# EAGLE design Adafruit LT8912B DSI to DVI Converter Rev B (EAGLE 9.6.2)
COMPANY: ADAFRUIT INDUSTRIES; DRAWN: KTOWN; REV: A
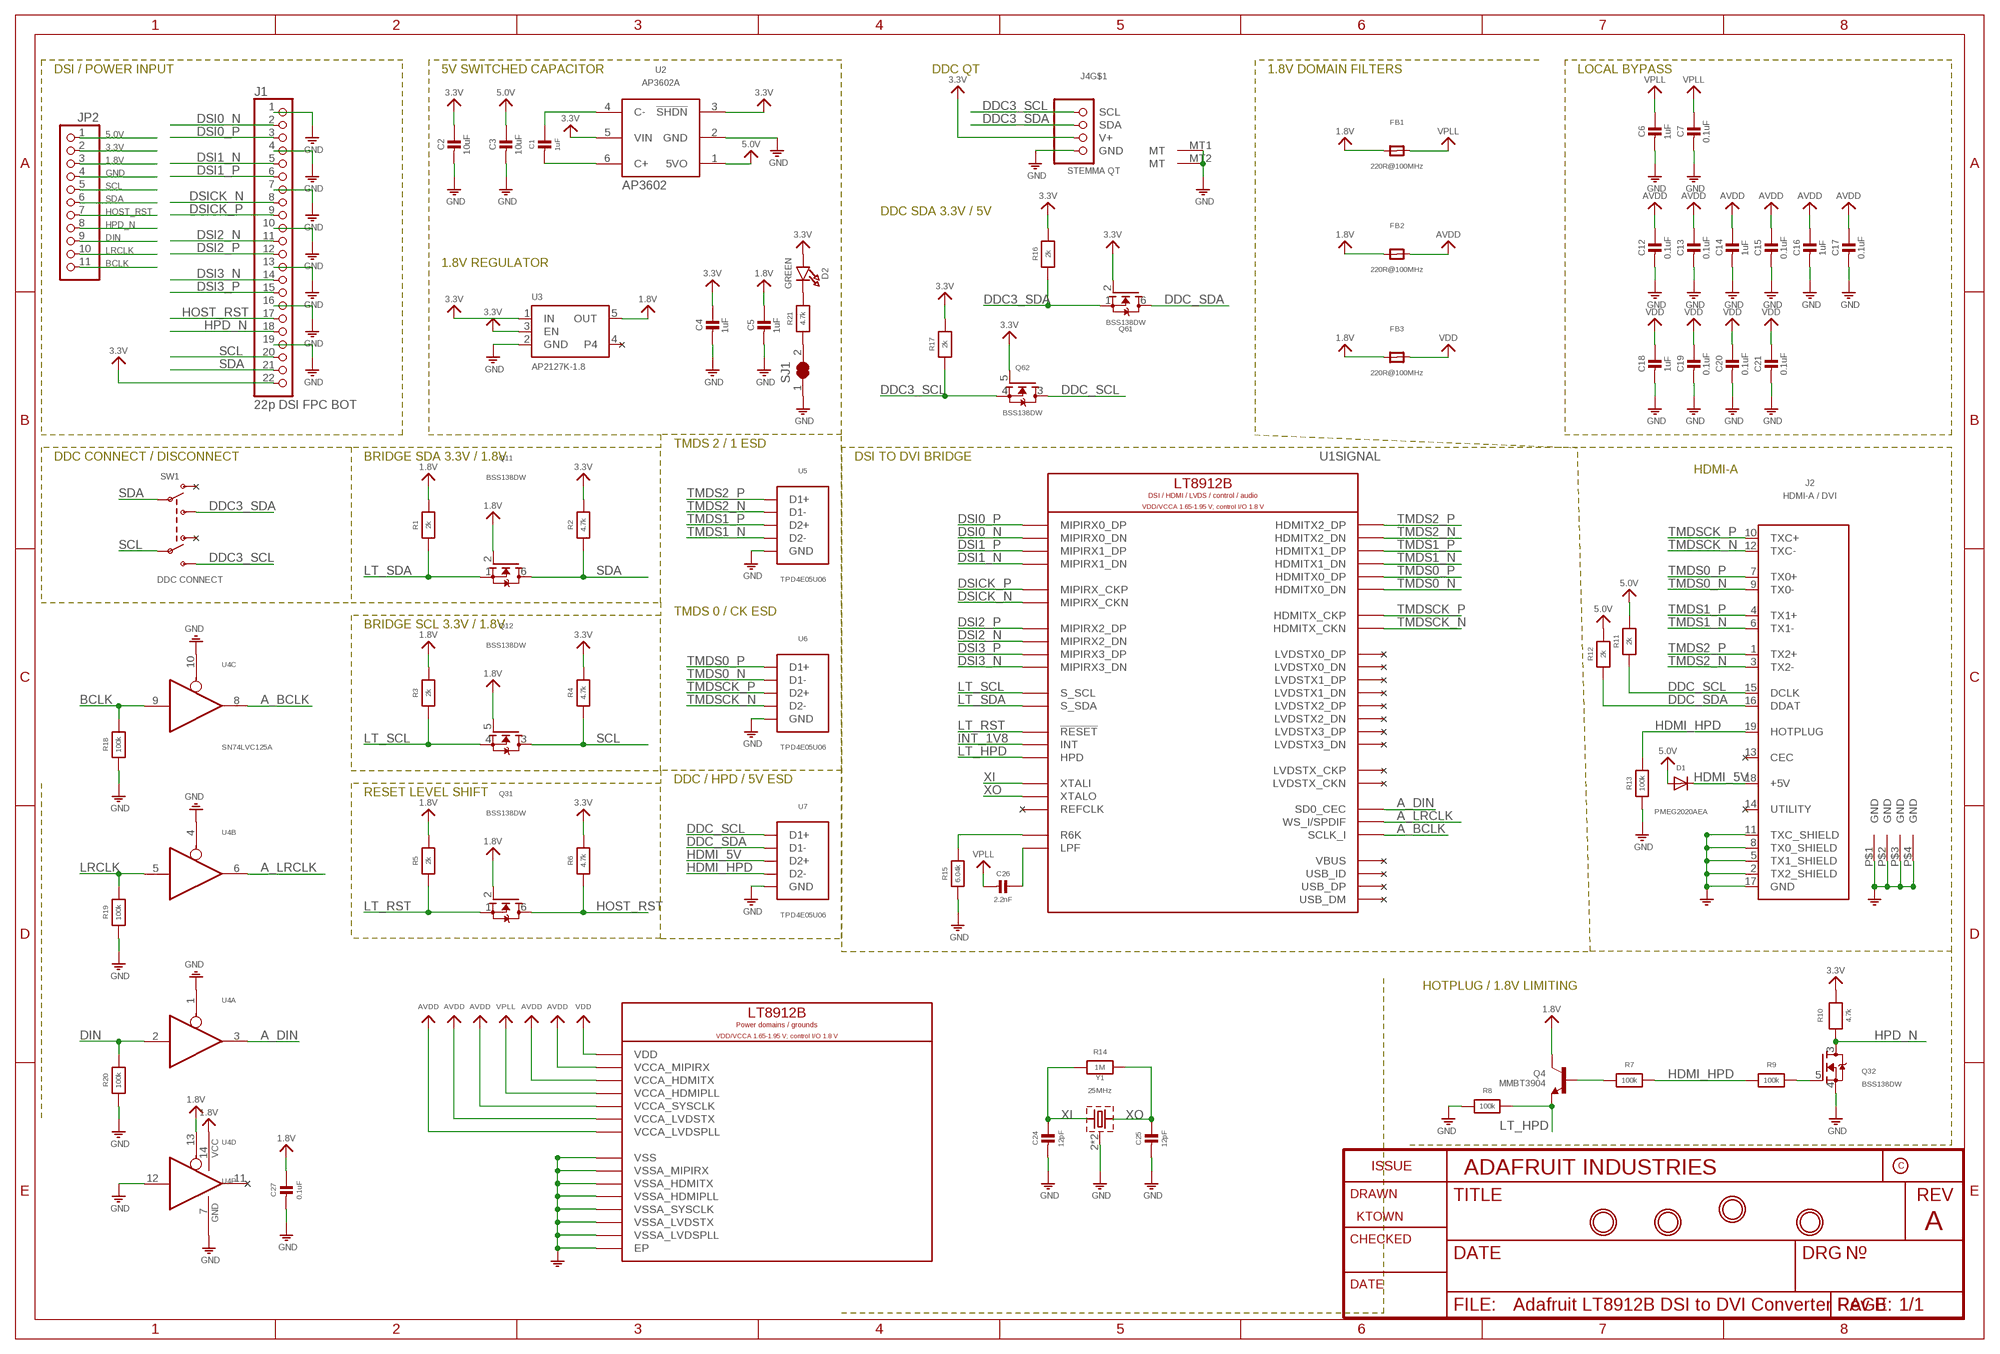
[diagram p0: schematic, sheet 1]

## Parts
C1  1uF  CAP_CERAMIC0603_NO  [0603-NO]
C2  10uF  CAP_CERAMIC0805-NOOUTLINE  [0805-NO]
C3  10uF  CAP_CERAMIC0805-NOOUTLINE  [0805-NO]
C4  1uF  CAP_CERAMIC0603_NO  [0603-NO]
C5  1uF  CAP_CERAMIC0603_NO  [0603-NO]
C6  1uF  CAP_CERAMIC0603_NO  [0603-NO]
C7  0.1uF  CAP_CERAMIC0603_NO  [0603-NO]
C12  0.1uF  CAP_CERAMIC0603_NO  [0603-NO]
C13  0.1uF  CAP_CERAMIC0603_NO  [0603-NO]
C14  1uF  CAP_CERAMIC0603_NO  [0603-NO]
C15  0.1uF  CAP_CERAMIC0603_NO  [0603-NO]
C16  1uF  CAP_CERAMIC0603_NO  [0603-NO]
C17  0.1uF  CAP_CERAMIC0603_NO  [0603-NO]
C18  1uF  CAP_CERAMIC0603_NO  [0603-NO]
C19  0.1uF  CAP_CERAMIC0603_NO  [0603-NO]
C20  0.1uF  CAP_CERAMIC0603_NO  [0603-NO]
C21  0.1uF  CAP_CERAMIC0603_NO  [0603-NO]
C24  12pF  CAP_CERAMIC0603_NO  [0603-NO]
C25  12pF  CAP_CERAMIC0603_NO  [0603-NO]
C26  2.2nF  CAP_CERAMIC0603_NO  [0603-NO]
C27  0.1uF  CAP_CERAMIC0603_NO  [0603-NO]
D1  PMEG2020AEA  DIODESOD-323F  [SOD-323F]
D2  GREEN  LED0603_NOOUTLINE  [CHIPLED_0603_NOOUTLINE]
FB1  220R@100MHz  FERRITE-0603NO  [0603-NO]
FB2  220R@100MHz  FERRITE-0603NO  [0603-NO]
FB3  220R@100MHz  FERRITE-0603NO  [0603-NO]
J1  22p DSI FPC BOT  HEADER-1X22_22PIN_0.5MM_BOT  [FPC_22PIN]
J2  HDMI-A / DVI  HDMI_MOLEX_47151  [HDMI_MOLEX_47151-0001]
J4  STEMMA QT  STEMMA_I2C_QT  [JST_SH4]
JP2  HEADER-1X11  [1X11_ROUND]
Q1  BSS138DW  MOSFET-N_DUAL  [SOT363]
Q3  BSS138DW  MOSFET-N_DUAL  [SOT363]
Q4  MMBT3904  TRANSISTOR_NPN  [SOT23-R]
Q6  BSS138DW  MOSFET-N_DUAL  [SOT363]
R1  2k  RESISTOR_0603_NOOUT  [0603-NO]
R2  4.7k  RESISTOR_0603_NOOUT  [0603-NO]
R3  2k  RESISTOR_0603_NOOUT  [0603-NO]
R4  4.7k  RESISTOR_0603_NOOUT  [0603-NO]
R5  2k  RESISTOR_0603_NOOUT  [0603-NO]
R6  4.7k  RESISTOR_0603_NOOUT  [0603-NO]
R7  100k  RESISTOR_0603_NOOUT  [0603-NO]
R8  100k  RESISTOR_0603_NOOUT  [0603-NO]
R9  100k  RESISTOR_0603_NOOUT  [0603-NO]
R10  4.7k  RESISTOR_0603_NOOUT  [0603-NO]
R11  2k  RESISTOR_0603_NOOUT  [0603-NO]
R12  2k  RESISTOR_0603_NOOUT  [0603-NO]
R13  100k  RESISTOR_0603_NOOUT  [0603-NO]
R14  1M  RESISTOR_0603_NOOUT  [0603-NO]
R15  6.04k  RESISTOR_0603_NOOUT  [0603-NO]
R16  2k  RESISTOR_0603_NOOUT  [0603-NO]
R17  2k  RESISTOR_0603_NOOUT  [0603-NO]
R18  100k  RESISTOR_0603_NOOUT  [0603-NO]
R19  100k  RESISTOR_0603_NOOUT  [0603-NO]
R20  100k  RESISTOR_0603_NOOUT  [0603-NO]
R21  4.7k  RESISTOR_0603_NOOUT  [0603-NO]
SJ1  SOLDERJUMPER_CLOSED  [SOLDERJUMPER_CLOSEDWIRE]
SW1  DDC CONNECT  SWITCH_DPDTEG1390  [EG1390]
U1  LT8912B  [QFN64_7.5X7.5_P04_EP62_LT8912B]
U2  AP3602A  AP3602  [SOT23-6]
U3  AP2127K-1.8  VREG_SOT23-5  [SOT23-5]
U4  SN74LVC125A  74125PW  [TSSOP14]
U5  TPD4E05U06  [USON10_1X2.5_P05_TPD4E05U06]
U6  TPD4E05U06  [USON10_1X2.5_P05_TPD4E05U06]
U7  TPD4E05U06  [USON10_1X2.5_P05_TPD4E05U06]
U$1  MOUNTINGHOLE2.5  [MOUNTINGHOLE_2.5_PLATED]
U$2  MOUNTINGHOLE2.5  [MOUNTINGHOLE_2.5_PLATED]
U$3  MOUNTINGHOLE2.5  [MOUNTINGHOLE_2.5_PLATED]
U$4  MOUNTINGHOLE2.5  [MOUNTINGHOLE_2.5_PLATED]
Y1  25MHz  CRYSTAL_GND2.0X1.6  [CRYSTAL_2X1.6]

## Nets
1.8V: C5.1 C27.1 FB1.1 FB2.1 FB3.1 JP2.3 Q1.2(1:G) Q1.5(2:G) Q3.2(1:G) Q4.3(C) R1.2 R3.2 R5.2 U3.5(OUT) U4.13(D:OE) U4.14(P:VCC)
3.3V: C2.1 C4.1 D2.A J1.22 J4.2(V+) JP2.2 Q6.2(1:G) Q6.5(2:G) R2.2 R4.2 R6.2 R10.2 R16.2 R17.2 U2.3(!SHDN) U2.5(VIN) U3.1(IN) U3.3(EN)
5.0V: C3.1 D1.A JP2.1 R11.2 R12.2 U2.1(5VO)
A_BCLK: U1.60(SIGNAL:SCLK_I) U4.8(C:O)
A_DIN: U1.58(SIGNAL:SD0_CEC) U4.3(A:O)
A_LRCLK: U1.59(SIGNAL:WS_I/SPDIF) U4.6(B:O)
AVDD: C12.1 C13.1 C14.1 C15.1 C16.1 C17.1 FB2.2 U1.5(POWER:VCCA_MIPIRX) U1.26(POWER:VCCA_HDMITX) U1.41(POWER:VCCA_LVDSTX) U1.50(POWER:VCCA_SYSCLK) U1.52(POWER:VCCA_LVDSPLL)
BCLK: JP2.11 R18.2 U4.9(C:I)
BIAS: R15.2 U1.13(SIGNAL:R6K)
DDC3_SCL: J4.4(SCL) Q6.4(2:S) R17.1 SW1.S2
DDC3_SDA: J4.3(SDA) Q6.1(1:S) R16.1 SW1.S1
DDC_SCL: J2.15(DCLK) Q6.3(2:D) R11.1 U7.1(D1+) U7.10(D1+)
DDC_SDA: J2.16(DDAT) Q6.6(1:D) R12.1 U7.2(D1-) U7.9(D1-)
DIN: JP2.9 R20.2 U4.2(A:I)
DSI0_N: J1.2 U1.2(SIGNAL:MIPIRX0_DN)
DSI0_P: J1.3 U1.1(SIGNAL:MIPIRX0_DP)
DSI1_N: J1.5 U1.4(SIGNAL:MIPIRX1_DN)
DSI1_P: J1.6 U1.3(SIGNAL:MIPIRX1_DP)
DSI2_N: J1.11 U1.10(SIGNAL:MIPIRX2_DN)
DSI2_P: J1.12 U1.9(SIGNAL:MIPIRX2_DP)
DSI3_N: J1.14 U1.12(SIGNAL:MIPIRX3_DN)
DSI3_P: J1.15 U1.11(SIGNAL:MIPIRX3_DP)
DSICK_N: J1.8 U1.8(SIGNAL:MIPIRX_CKN)
DSICK_P: J1.9 U1.7(SIGNAL:MIPIRX_CKP)
FLY_+: C1.2 U2.6(C+)
FLY_-: C1.1 U2.4(C-)
GND: C2.2 C3.2 C4.2 C5.2 C6.2 C7.2 C12.2 C13.2 C14.2 C15.2 C16.2 C17.2 C18.2 C19.2 C20.2 C21.2 C24.2 C25.2 C27.2 J1.1 J1.4 J1.7 J1.10 J1.13 J1.16 J1.19 J2.2(TX2_SHIELD) J2.5(TX1_SHIELD) J2.8(TX0_SHIELD) J2.11(TXC_SHIELD) J2.17(GND) J2.P$1(GND) J2.P$2(GND) J2.P$3(GND) J2.P$4(GND) J4.1(GND) J4.MT1(MT) J4.MT2(MT) JP2.4 Q3.4(2:S) R8.1 R13.1 R15.1 R18.1 R19.1 R20.1 SJ1.1 U1.6(POWER:VSSA_MIPIRX) U1.17(POWER:VSS) U1.23(POWER:VSSA_HDMITX) U1.29(POWER:VSSA_HDMITX) U1.32(POWER:VSS) U1.36(POWER:VSSA_HDMIPLL) U1.42(POWER:VSSA_LVDSTX) U1.49(POWER:VSSA_SYSCLK) U1.51(POWER:VSSA_LVDSPLL) U1.56(POWER:VSS) U1.EP(POWER:EP) U2.2(GND) U3.2(GND) U4.1(A:OE) U4.4(B:OE) U4.7(P:GND) U4.10(C:OE) U4.12(D:I) U5.3(GND) U5.8(GND) U6.3(GND) U6.8(GND) U7.3(GND) U7.8(GND) Y1.2(GND) Y1.4(GND)
HDMI_5V: D1.C J2.18(+5V) U7.4(D2+) U7.7(D2+)
HDMI_HPD: J2.19(HOTPLUG) R7.1 R9.1 R13.2 U7.5(D2-) U7.6(D2-)
HOST_RST: J1.17 JP2.7 Q3.6(1:D) R6.1
HPD_BASE: Q4.1(B) R7.2
HPD_HOST_B: Q3.5(2:G) R9.2
HPD_N: J1.18 JP2.8 Q3.3(2:D) R10.1
INT_1V8: U1.63(SIGNAL:INT)
LPF: C26.1 U1.35(SIGNAL:LPF)
LRCLK: JP2.10 R19.2 U4.5(B:I)
LT_HPD: Q4.2(E) R8.2 U1.14(SIGNAL:HPD)
LT_RST: Q3.1(1:S) R5.1 U1.64(SIGNAL:!RESET)
LT_SCL: Q1.4(2:S) R3.1 U1.62(SIGNAL:S_SCL)
LT_SDA: Q1.1(1:S) R1.1 U1.61(SIGNAL:S_SDA)
N$1: R21.1 SJ1.2
N$2: D2.C R21.2
SCL: J1.20 JP2.5 Q1.3(2:D) R4.1 SW1.P2
SDA: J1.21 JP2.6 Q1.6(1:D) R2.1 SW1.P1
TMDS0_N: J2.9(TX0-) U1.24(SIGNAL:HDMITX0_DN) U6.2(D1-) U6.9(D1-)
TMDS0_P: J2.7(TX0+) U1.25(SIGNAL:HDMITX0_DP) U6.1(D1+) U6.10(D1+)
TMDS1_N: J2.6(TX1-) U1.27(SIGNAL:HDMITX1_DN) U5.5(D2-) U5.6(D2-)
TMDS1_P: J2.4(TX1+) U1.28(SIGNAL:HDMITX1_DP) U5.4(D2+) U5.7(D2+)
TMDS2_N: J2.3(TX2-) U1.30(SIGNAL:HDMITX2_DN) U5.2(D1-) U5.9(D1-)
TMDS2_P: J2.1(TX2+) U1.31(SIGNAL:HDMITX2_DP) U5.1(D1+) U5.10(D1+)
TMDSCK_N: J2.12(TXC-) U1.21(SIGNAL:HDMITX_CKN) U6.5(D2-) U6.6(D2-)
TMDSCK_P: J2.10(TXC+) U1.22(SIGNAL:HDMITX_CKP) U6.4(D2+) U6.7(D2+)
VDD: C18.1 C19.1 C20.1 C21.1 FB3.2 U1.18(POWER:VDD) U1.33(POWER:VDD) U1.57(POWER:VDD)
VPLL: C6.1 C7.1 C26.2 FB1.2 U1.34(POWER:VCCA_HDMIPLL)
XI: C24.1 R14.1 U1.53(SIGNAL:XTALI) Y1.1
XO: C25.1 R14.2 U1.54(SIGNAL:XTALO) Y1.3
Unconnected: J2.13(CEC) J2.14(UTILITY) SW1.O1 SW1.O2 U1.15(SIGNAL:VBUS) U1.16(SIGNAL:USB_ID) U1.19(SIGNAL:USB_DP) U1.20(SIGNAL:USB_DM) U1.37(SIGNAL:LVDSTX3_DP) U1.38(SIGNAL:LVDSTX3_DN) U1.39(SIGNAL:LVDSTX_CKP) U1.40(SIGNAL:LVDSTX_CKN) U1.43(SIGNAL:LVDSTX2_DP) U1.44(SIGNAL:LVDSTX2_DN) U1.45(SIGNAL:LVDSTX1_DP) U1.46(SIGNAL:LVDSTX1_DN) U1.47(SIGNAL:LVDSTX0_DP) U1.48(SIGNAL:LVDSTX0_DN) U1.55(SIGNAL:REFCLK) U3.4 U4.11(D:O)

## Notes on the sheet
- DSI / POWER INPUT | 5V SWITCHED CAPACITOR | DDC QT | 1.8V DOMAIN FILTERS | LOCAL BYPASS
- DDC SDA 3.3V / 5V
- 1.8V REGULATOR
- TMDS 2 / 1 ESD
- DDC CONNECT / DISCONNECT | BRIDGE SDA 3.3V / 1.8V | DSI TO DVI BRIDGE
- HDMI-A
- TMDS 0 / CK ESD
- BRIDGE SCL 3.3V / 1.8V
- DDC / HPD / 5V ESD
- RESET LEVEL SHIFT
- HOTPLUG / 1.8V LIMITING

## Library data of the parts
C1-C7 C12-C21 C24-C27 = microbuilder:CAP_CERAMIC: Ceramic Capacitors For new designs, use the packages preceded by an '_' character since they are more reliable: The following footprints should be used on most boards: _0402 - Standard footprint for regular board layouts _0603 - Standard footprint for regular board layouts _0805 - Standard footprint for regular board layouts _1206 - Standard footprint for regular board layouts For extremely tight-pitch boards where space is at a premium, the following 'micro-pitch' footprints can be used (smaller pads, no silkscreen outline, etc.): _0402MP - Micro-pitch footprint for very dense/compact boards _0603MP - Micro-pitch footprint for very dense/compact boards _0805MP - Micro-pitch footprint for very dense/compact boards _1206MP - Micro-pitch footprint for very dense/compact boards
D1 = adafruit:DIODE: Diode SMADIODE - SMA Surface Mount Package 20V 1A Schottky Diode Digikey: 641-1014-6-ND DO-1N4148 - Through Hole Small Current Diode SOD-123 20V 1 A (.5mV Vf) Schottky Diode - Digikey: MBRX120TPMSCT-ND SOD-323 10V 570mA (.38mV Vf, 3ns) Schottky Diode - Digikey: ZLLS410CT-ND SOD-523 30V 30mA Schottky Diode (RB751S-40TE61) - Digikey: RB751S-40TE61CT-ND SOT23-R/W - SOT23 Package (R = Solder Paste/Reflow Ovens, W = Hand-Soldering) BAT54Film 40V 300mA - Digikey: 497-7162-1-ND; LCSC: C389354; MPN: PMEG2020AEA
D2 = microbuilder:LED: LED 0603 - 0603 Surface Mount Package 2mA: Green LED - Low Power (3.9mcd, 2ma, 1.7Vf) - Digikey: 475-2709-2-ND Orange LED - Low Power (9.8mcd, 2ma, 1.8Vf) - Digikey: 475-1194-2-ND Red LED - Low Power (5mcd, 2ma, 1.8Vf) - Digikey: 475-1195-2-ND Yellow LED - Low Power (7mcd, 2ma, 1.8Vf) - Digikey: 475-1196-2-ND 5mA: Blue LED - Low Power (17mcd, 5ma, 2.9Vf) - Digikey: LNJ937W8CRACT-ND 0805 - 0805 Surface Mount Package 2mA: Red LED (8.8mcd, 2mA, 1.8Vf, Clear) - Low Power [Digikey: 475-2510-1-ND] Green LED (5mcd, 2mA, 1.8Vf, Clear) - Low Power [Digikey: 475-2730-1-ND] Yellow LED (11.3mcd, 2mA, 1.8Vf, Clear) - Low Power [Digikey: 475-2555-1-ND] 20mA: Red LED (104mcd, 20mA, Diffused) - LS R976 [Digikey: 475-1278-6-ND] Red LED (12mcd, 20mA, 2.0Vf, Clear) - APT2012EC [Digikey: 754-1128-1-ND] Green LED (15mcd, 20mA, 2.2Vf, Clear) - APT2012GC [Digikey: 754-1131-1-ND] Orange LED (160mcd, 20mA, 2.1Vf, Clear) - APT2012SECK [Digikey: 754-1130-1-ND] 1206 - 1206 Surface Mount Package Green LED (26mcd, 20mA, Diffused) - LG N971 [Digikey: 475-1407-6-ND] Red LED (15mcd, 20mA, Diffused) - LH N974 [Digikey: 475-1416-6-ND] Cree - Cree High-Power Surface Mount LEDs XPEBWT-L1-0000-00D50 - White 111lm 350mA 2.9Vf 6200K 110° XTEAWT-00-0000-00000LEE3 - White 114lm 350mA 2.85Vf 5000K 115° Everlight - Everlight 45-21 Series Surface Mount LEDs 45-21/QK2C-B2832AC2CB2/2T - Warm White 2000mcd 20mA 3.25Vf 3050K 120° 45-21/LK2C-B38452C4CB2/2T - Nuetral White 2000mcd 20mA 3.25Vf 4150K 120° 45-21/LK2C-B50634C6CB2/2T - Cold White 2200mcd 20mA 3.25Vf 5650K 120° PLCC2 Reverse Mount LS T77K-J1L2-1-0-2-R18-Z - Red 11.25mcd 2mA 1.8Vf 630nm 120° LO T77K-L1M2-24-Z - Orange 19.6mcd 2mA 1.8Vf 606nm 120° LY T77K-K2M1-26-Z - Yellow 15.7mcd 2mA 1.8Vf 587nm 120°; ROT: 270
FB1-FB3 = microbuilder:FERRITE: Ferrite Bead 0603 MMZ1608B121C - 120 Ohm @ 100MHz, 600mA, 0.15 Ohm DC Resistance - Digikey: 445-2164-1-ND BK1608HW121-T - 120 Ohm, 600mA Ferrite Chip - Digikey: 587-1876-2-ND 0805 HZ0805B272R-10 - 2.7K Ohm @ 100MHz, 200mA, 0.8 Ohm DC Resistance - Digikey: 240-2504-1-ND (see also Murata BLM21BD272SN1L) MMZ2012Y152B - 1.5K Ohm @ 100MHz, 500mA, 0.4 Ohm DC Resistance - Digikey: 445-1560-1-ND - Mainly for high frequency (80-400MHz) MMZ2012R102A - 1K Ohm @ 100MHz, 500mA, 0.3 Ohm DC Resistance - Digikey: 445-1555-2-ND - More general purpose (10-200MHz); SELECTION_STATUS: MPN/current/DCR to qualify
J1 = adafruit_electromech:HEADER-1X22; LCSC: C262668; MPN: AFC01-S22FCA-00
J2 = adafruit_electromech:HDMI_MOLEX_47151: The default footprint uses layer 46 (Milling) for the tabs, the DIMLAYER footprint uses layer 20 (Dimensions). Both will probably require special instructions to the board house; LCSC: C138388; MPN: HDMI-001 19PCBTP
J4 = adafruit_electromech:STEMMA_I2C; LCSC: C2905006
JP2 = microbuilder:HEADER-1X11
Q1 Q3 Q6 = microbuilder:MOSFET-N_DUAL: Dual N-Channel MOSFET SOT363 (2.0x1.25mm) 2N7002PS - 60V, 320mA [Digikey: 568-5984-1-ND]; JLC_ROTATION: 270; LCSC: C154900; MPN: BSS138DW-7-F
Q4 = microbuilder:TRANSISTOR_NPN: NPN Transistor Transistor (NPN) 500mA 45V - BC817 [Digikey: 568-1631-1-ND] Transistor (NPN) 500mA 45V - BC817,215 [Mouser: 771-BC817-T/R] SOT23-R - SOT23 footprint optimised for use with solder paste and reflow ovens. SOT23-W - SOT23 footprint optimised for hand-soldering (larger pads).
R1-R21 = microbuilder:RESISTOR: Resistors For new designs, use the packages preceded by an '_' character since they are more reliable: The following footprints should be used on most boards: _0402 - Standard footprint for regular board layouts _0603 - Standard footprint for regular board layouts _0805 - Standard footprint for regular board layouts _1206 - Standard footprint for regular board layouts For extremely tight-pitch boards where space is at a premium, the following 'micro-pitch' footprints can be used (smaller pads, no silkscreen outline, etc.): _0402MP - Micro-pitch footprint for very dense/compact boards _0603MP - Micro-pitch footprint for very dense/compact boards _0805MP - Micro-pitch footprint for very dense/compact boards _1206MP - Micro-pitch footprint for very dense/compact boards
SJ1 = microbuilder:SOLDERJUMPER_CLOSED: Solder Jumper - Closed These solder jumpers are closed by default CLOSEDWIRE - 10 mil trace between pads that can be cut and resoldered later CLOSEDPERM - 63 mil trace between pads for a permanent connection (used to 'bridge' two signals, a shameless hack for Eagle). Can double as a test point as well (no cream layer)
SW1 = adafruit_electromech:SWITCH_DPDT: Switch - DPDT A DPDT Switch acts like an SPDT switch, but has a pair of switches instead of just one. Vertical - 0.3A @ 6V SMT - Digikey: JS202011SCQN; LCSC: C2837066; MPN: MS-22C01-G010
U1 = adafruit_display:LT8912B: Lontium LT8912B / LCSC C2892102, single-channel MIPI DSI to HDMI/LVDS. QFN64 7.5 mm, single 1.8 V supply; CMOS pins are NOT 3.3 V tolerant. SIGNAL and POWER gates retain all 64 functional pads plus EP. Unused DSI lanes, LVDS/audio/USB functions remain real pins, not NC. RESET_N is drawn as !RESET; INT is multifunction I/O, without an inferred overbar. No DDC/HDCP. Host must provide monitor DDC separately. Pin map: LT8912B R1.13 table 6.2.1, matching LT8912 R1.7 pin-function table and Espressif ESP-HDMI-Bridge 2024-08-28. Do not use the inconsistent overview pin diagram in the old combined datasheet.; LCSC: C2892102; MANUFACTURER: Lontium Semiconductor; MPN: LT8912B
U2 = microbuilder:AP3602; LCSC: C460358; MPN: AP3602AKTR-G1
U3 = adafruit_power:VREG_SOT23-5: SOT23-5 Fixed Voltage Regulators Part Current Out V Out V In V Dropout θJA (°C/W) TJ (°C) Digikey Part No. ADP121 150mA 3.3V 3.4-5.5V 0.09V @ 150mA -- -- ADP121-AUJZ33R7CT-ND ADP121 150mA 3.0V 3.1-5.5V 0.09V @ 150mA -- -- ADP121-AUJZ30R7CT-ND ADP122 300mA 3.3V 3.4-5.5V 0.085V @ 300mA -- -- ADP122AUJZ-3.3-R7CT-ND ADP1712 300mA 3.3V 3.5-5.5V 0.17V @ 300mA -- -- ADP1712AUJZ-3.3-R7TR-ND AP7311 (Low Cost) 150mA 3.3V 3.5-6V 0.15V @ 150mA -- -- AP7311-33WG-7DICT-ND LD39015M18R 150mA 1.8V 1.9V-5.5V 0.08V @ 100mA -- -- 497-6977-1-ND LP2985A-33DBVR 150mA 3.3V 3.3-16V 0.28V @ 150mA 206 150 296-18479-1-ND MCP1824T-3302E/OT 300mA 3.3V 3.5V-6V 0.2V @ 300mA -- -- MCP1824T-3302E/OTCT-ND MIC5205-2.5YM5 TR 150mA 2.5V 2.7-16V 0.165V @ 150mA -- -- 576-1257-2-ND MIC5205-3.0YM5 TR 150mA 3.0V 3.2V-16V 0.165V @ 150mA -- -- 576-1258-2-ND MIC5205-3.3YM5 TR 150mA 3.3V 3.5V-16V 0.165V @ 150mA -- -- 576-1259-2-ND TPS780330220 150mA 3.3V+2.2V 3.6-5.5V 250mV Max -- -- 296-23332-1-ND TDA3663/N1,135 100mA 3.3V 3.5-45V 0.18V @ 50mA -- -- 568-5343-1-ND Max operating temp can be calculated using θJA, TJ (max junction temperature), and power in watts. Set the "Maximum Ambient Temperature" until it reaches TJ ("Max Junction Temperature"), which is the absolute limit for safe use of the regulator: Heat Sink Temperature Calculator <http://www.daycounter.com/Calculators/Heat-Sink-Temperature-Calculator.phtml> For example, With 12V source into a 3.3V LP2985 and a 30mA load, we are dissipating (12V-3.3V) * 0.03A = 0.261W. With a θJA of 206 °C/W, a TJ of 150°C, and 261mW we can safely use the chip without a heat sink up to 75°C (=147.1°C Junction Temperature).; JLC_ROTATION: 270; LCSC: C151375; MPN: AP2127K-1.8TRG1
U4 = adafruit:74*125: Quad bus BUFFER, 3-state; LCSC: C7813; MPN: SN74LVC125APWR
U5-U7 = adafruit_power:TPD4E05U06: Genuine Texas Instruments TPD4E05U06DQAR, C138714. Four 5.5 V ESD channels, 0.5 pF typical; HDMI application in SLVSBO7O p.13. GND maps to pads 3 and 8 with route=all. Pads 6,7,9,10 are internally NC but used for PCB pass-through routing per TI SLVSBO7O pp.4/17. Signal pairs 1-10, 2-9, 4-7, 5-6 use route=all and must be joined by PCB traces; they are not internally connected. Place beside the connector with short signal and ground paths.; LCSC: C138714; MANUFACTURER: Texas Instruments; MPN: TPD4E05U06DQAR
U$1-U$4 = adafruit_electromech:MOUNTINGHOLE: Mounting Hole For #2 screws (0.086"/2.18mm width, 0.094"/2.4mm hole) use 2.5mm; BOM: EXCLUDE
Y1 = microbuilder:CRYSTAL_GND: Shielded SMD Crystal (case to GND) 4-pad SMD crystal where the case/shield pads are bonded to GND for EMI suppression and mechanical anchoring. Use this variant in place of the standard 2-pin CRYSTAL when you want the can grounded. Add more package sizes as new SMDxxxx-4P footprints are added to the library. 2.0 x 1.6mm - SMD2016-4P 4-pad ceramic package Smallest commonly stocked low-cost size; ≥24 MHz only (low-frequency parts won't fit). E.g. 24/26 MHz 8-9pF. 2.5 x 2.0mm - SMD2520-4P 4-pad ceramic package Common compact size; ≥16 MHz typical. E.g. 16/24/26 MHz 8-12pF. 3.2 x 2.5mm - SMD3225-4P 4-pad ceramic package General-purpose; supports 8 MHz and up. E.g. YXC X32258MOB4SI 8MHz/12pF, LCSC C9002 family.; LCSC: C193187; MPN: Q22FA12800569; SELECTION_STATUS: House 25MHz CL8pF ESR80ohm max drive100uW; startup/drive require prototype verification

## Board
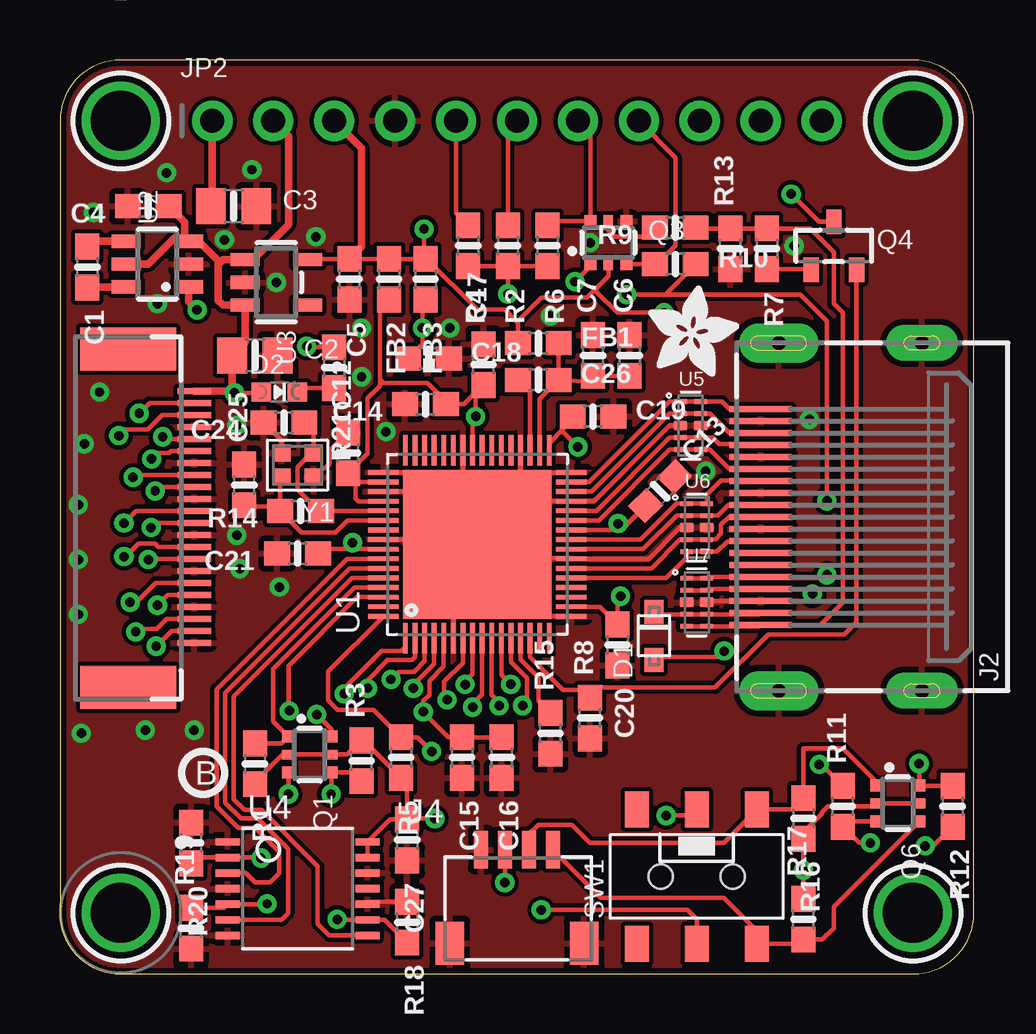
[diagram p1: board, top side]
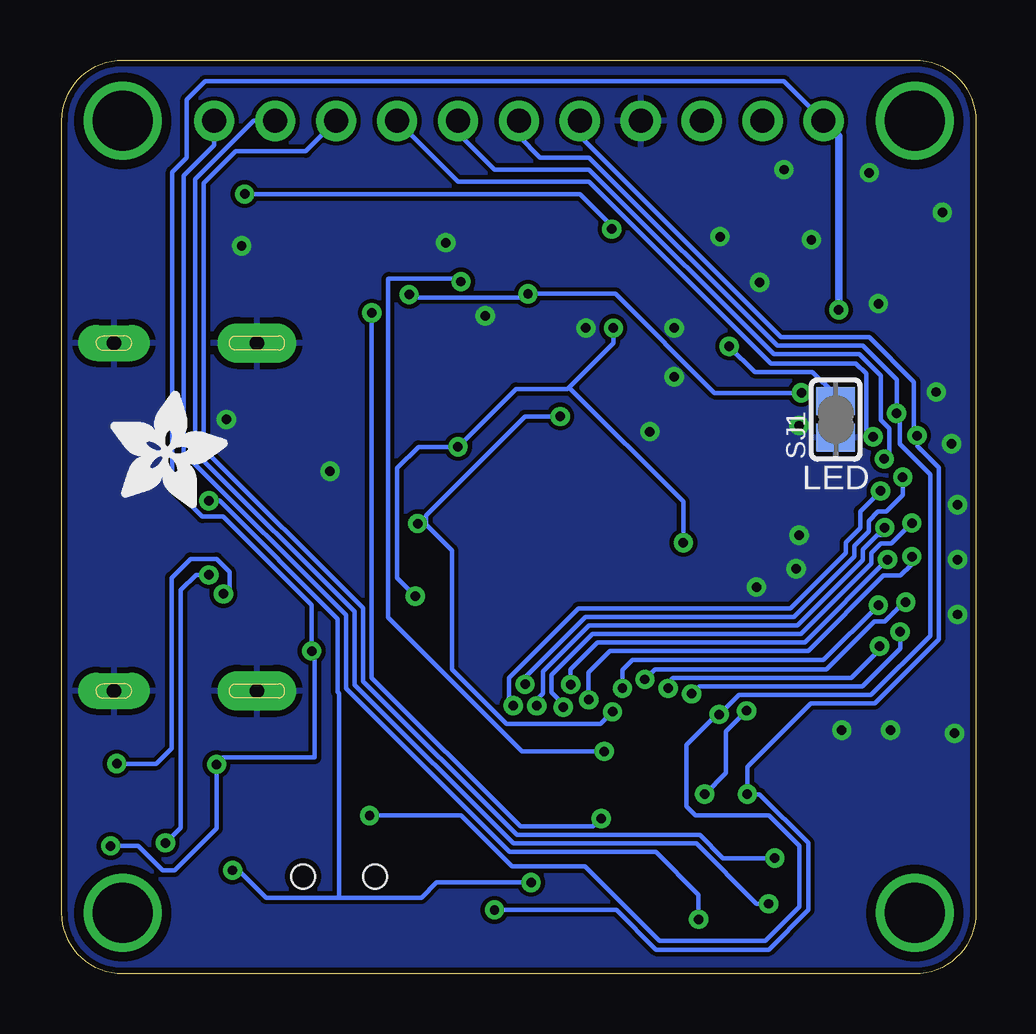
[diagram p2: board, bottom side, seen from below]

Size 38.1 x 38.1 mm. Coordinates in mm from the lower left corner, seen from the top.
Outline: 0,35.56 0,2.54 arc90 2.54,0 35.56,0 arc90 38.1,2.54 38.1,35.56 arc90 35.56,38.1 2.54,38.1 arc90 0,35.56
Copper layers (1*16): Top 0.035mm / dielectric 1.5mm / Bottom 0.035mm
Design rules "adafruit 7-7": minimum track width 7mil, minimum drill 15.5mil, track to track 7mil, track to pad 7mil, pad to pad 7mil, via to via 7mil, smd to smd 7mil, copper to edge 10mil, drill to drill 8mil, minimum pad ring 7mil, minimum via ring 8mil, stop-mask expansion 2mil, vias tented up to drill 20mil, thermal gap 10mil

### Footprints (pad centres in the part's own frame; a part is rotated, then mirrored left to right if it is on the bottom)
0603-NO = smd 1.075 x 1: 1 -0.85,0; 2 0.85,0
0805-NO = smd 1.24 x 1.5: 1 -0.95,0; 2 0.95,0
SOD-323F = smd 1 x 0.8: A -1,0; C 1,0
CHIPLED_0603_NOOUTLINE = smd 0.8 x 0.8: A 0,-0.75; C 0,0.75
FPC_22PIN = smd 0.25 x 1.4: 1 -5.25,-1.154; 2 -4.75,-1.154; 3 -4.25,-1.154; 4 -3.75,-1.154; 5 -3.25,-1.154; 6 -2.75,-1.154; 7 -2.25,-1.154; 8 -1.75,-1.154; 9 -1.25,-1.154; 10 -0.75,-1.154; 11 -0.25,-1.154; 12 0.25,-1.154; 13 0.75,-1.154; 14 1.25,-1.154; 15 1.75,-1.154; 16 2.25,-1.154; 17 2.75,-1.154; 18 3.25,-1.154; 19 3.75,-1.154; 20 4.25,-1.154; 21 4.75,-1.154; 22 5.25,-1.154 | smd 1.8 x 4: SUPPORT1 7,1.598; SUPPORT2 -7.1,1.598
HDMI_MOLEX_47151-0001 = smd 0.25 x 2.6: 1 4.5,3.302; 2 4,3.302; 3 3.5,3.302; 4 3,3.302; 5 2.5,3.302; 6 2,3.302; 7 1.5,3.302; 8 1,3.302; 9 0.5,3.302; 10 0,3.302; 11 -0.5,3.302; 12 -1,3.302; 13 -1.5,3.302; 14 -2,3.302; 15 -2.5,3.302; 16 -3,3.302; 17 -3.5,3.302; 18 -4,3.302; 19 -4.5,3.302 | drill 0.6 pad 1.65 long: P$1 -7.25,2.542; P$2 7.25,2.542 | drill 0.6 pad 1.5 long: P$3 7.25,-3.418; P$4 -7.25,-3.418
JST_SH4 = smd 0.6 x 1.55: 1 -1.5,2.006; 2 -0.5,2.006; 3 0.5,2.006; 4 1.5,2.006 | smd 1.2 x 1.8: MT1 -2.8,-1.894; MT2 2.8,-1.894
1X11_ROUND = drill 1 pad 1.676: 1 -12.7,0; 2 -10.16,0; 3 -7.62,0; 4 -5.08,0; 5 -2.54,0; 6 0,0; 7 2.54,0; 8 5.08,0; 9 7.62,0; 10 10.16,0; 11 12.7,0
SOT363 = smd 0.5 x 0.5: 1 -0.75,-0.9; 3 0.75,-0.9; 4 0.75,0.9; 6 -0.75,0.9 | smd 0.4 x 0.5: 2 0,-0.9; 5 0,0.9
SOT23-R = smd 0.635 x 1.016: 1 -0.95,-1; 2 0.95,-1; 3 0,1
SOLDERJUMPER_CLOSEDWIRE = smd 1.168 x 1.6: 1 -0.762,0; 2 0.762,0 | smd 0.635 x 0.203: WIRE 0,0
EG1390 = smd 1 x 1.5: O1 -2.5,2.8; O2 -2.5,-2.8; P1 0,2.8; P2 0,-2.8; S1 2.5,2.8; S2 2.5,-2.8 | hole 1: 1.5,0; -1.5,0
QFN64_7.5X7.5_P04_EP62_LT8912B = smd 1.27 x 0.2: 1 -3.915,3; 2 -3.915,2.6; 3 -3.915,2.2; 4 -3.915,1.8; 5 -3.915,1.4; 6 -3.915,1; 7 -3.915,0.6; 8 -3.915,0.2; 9 -3.915,-0.2; 10 -3.915,-0.6; 11 -3.915,-1; 12 -3.915,-1.4; 13 -3.915,-1.8; 14 -3.915,-2.2; 15 -3.915,-2.6; 16 -3.915,-3; 33 3.915,-3; 34 3.915,-2.6; 35 3.915,-2.2; 36 3.915,-1.8; 37 3.915,-1.4; 38 3.915,-1; 39 3.915,-0.6; 40 3.915,-0.2; 41 3.915,0.2; 42 3.915,0.6; 43 3.915,1; 44 3.915,1.4; 45 3.915,1.8; 46 3.915,2.2; 47 3.915,2.6; 48 3.915,3 | smd 0.2 x 1.27: 17 -3,-3.915; 18 -2.6,-3.915; 19 -2.2,-3.915; 20 -1.8,-3.915; 21 -1.4,-3.915; 22 -1,-3.915; 23 -0.6,-3.915; 24 -0.2,-3.915; 25 0.2,-3.915; 26 0.6,-3.915; 27 1,-3.915; 28 1.4,-3.915; 29 1.8,-3.915; 30 2.2,-3.915; 31 2.6,-3.915; 32 3,-3.915; 49 3,3.915; 50 2.6,3.915; 51 2.2,3.915; 52 1.8,3.915; 53 1.4,3.915; 54 1,3.915; 55 0.6,3.915; 56 0.2,3.915; 57 -0.2,3.915; 58 -0.6,3.915; 59 -1,3.915; 60 -1.4,3.915; 61 -1.8,3.915; 62 -2.2,3.915; 63 -2.6,3.915; 64 -3,3.915 | smd 6.2 x 6.2: EP 0,0
SOT23-6 = smd 0.55 x 1.2: 1 -0.95,-1.3; 2 0,-1.3; 3 0.95,-1.3; 4 0.95,1.3; 5 0,1.3; 6 -0.95,1.3
SOT23-5 = smd 0.55 x 1.2: 1 -0.95,-1.3; 2 0,-1.3; 3 0.95,-1.3; 4 0.95,1.3; 5 -0.95,1.3
TSSOP14 = smd 0.305 x 0.991: 1 -1.95,-2.918; 2 -1.3,-2.918; 3 -0.65,-2.918; 4 0,-2.918; 5 0.65,-2.918; 6 1.3,-2.918; 7 1.95,-2.918; 8 1.95,2.918; 9 1.3,2.918; 10 0.65,2.918; 11 0,2.918; 12 -0.65,2.918; 13 -1.3,2.918; 14 -1.95,2.918
USON10_1X2.5_P05_TPD4E05U06 = smd 0.565 x 0.2: 1 -0.417,1; 2 -0.417,0.5; 4 -0.417,-0.5; 5 -0.417,-1; 6 0.417,-1; 7 0.417,-0.5; 9 0.417,0.5; 10 0.417,1 | smd 0.565 x 0.4: 3 -0.417,0; 8 0.417,0
MOUNTINGHOLE_2.5_PLATED = drill 2.5 pad 3.2: P$1 0,0
CRYSTAL_2X1.6 = smd 0.75 x 0.7: 1 -0.675,-0.5; 2 0.675,-0.5; 3 0.675,0.5; 4 -0.675,0.5

### Placement (x,y rotation side)
C1  1.14,29.46 270 top
C2  8.13,25.78 0 top
C3  7.24,32 0 top
C4  3.68,32 180 top
C5  12.06,28.96 270 top
C6  23.75,25.78 90 top
C7  22.23,25.78 90 top
C12  12,21.72 90 top
C13  25.02,20.13 45 top
C14  15.24,23.75 180 top
C15  16.76,9.02 270 top
C16  18.41,9.02 270 top
C17  17.65,25.4 90 top
C18  15.37,25.65 0 top
C19  22.23,23.24 0 top
C20  23.24,13.72 270 top
C21  9.91,17.53 180 top
C24  9.33,22.99 180 top
C25  7.68,20.38 90 top
C26  19.94,24.77 0 top
C27  14.48,5.59 270 top
D1  24.77,14.1 90 top
D2  9.14,24.26 270 top
FB1  19.94,26.29 0 top
FB2  13.72,28.96 270 top
FB3  15.24,28.96 270 top
J1  4.45,19.05 90 top
J2  32.51,19.05 90 top
J4  19.05,3.17 0 top
JP2  19.05,35.56 0 top
PLABEL0  [PLABEL0]  6.35,37.12 0 top
PLABEL1  [PLABEL1]  8.89,33.95 0 top
PLABEL2  [PLABEL2]  11.43,37.12 0 top
PLABEL3  [PLABEL3]  13.97,33.95 0 top
PLABEL4  [PLABEL4]  16.51,37.12 0 top
PLABEL5  [PLABEL5]  19.18,33.95 0 top
PLABEL6  [PLABEL6]  21.59,37.12 0 top
PLABEL7  [PLABEL7]  24.13,33.95 0 top
PLABEL8  [PLABEL8]  26.67,37.12 0 top
PLABEL9  [PLABEL9]  29.21,33.95 0 top
PLABEL10  [PLABEL10]  31.75,37.12 0 top
PLABEL11  [PLABEL11]  34.06,28 0 top
PLABEL12  [PLABEL12]  19.05,6.8 0 top
PLABEL13  [PLABEL13]  26.46,9.1 0 top
PLABEL14  [PLABEL14]  2.54,7.75 0 top
PLABEL15  [PLABEL15]  10.16,11.81 0 top
PLABEL16  [PLABEL16]  5.92,25.65 90 top
PLABEL17  [PLABEL17]  5.8,13.08 90 top
PLABEL18  [PLABEL18]  25.33,1.14 90 top
PLABEL19  [PLABEL19]  27.74,1.14 90 top
PLABEL20  [PLABEL20]  6.35,37.25 0 bottom
PLABEL21  [PLABEL21]  8.89,33.7 0 bottom
PLABEL22  [PLABEL22]  11.43,37.25 0 bottom
PLABEL23  [PLABEL23]  13.97,33.7 0 bottom
PLABEL24  [PLABEL24]  16.51,37.25 0 bottom
PLABEL25  [PLABEL25]  19.05,33.7 0 bottom
PLABEL26  [PLABEL26]  21.59,37.25 0 bottom
PLABEL27  [PLABEL27]  24.13,33.7 0 bottom
PLABEL28  [PLABEL28]  26.67,37.25 0 bottom
PLABEL29  [PLABEL29]  29.21,33.7 0 bottom
PLABEL30  [PLABEL30]  31.75,37.25 0 bottom
PLABEL31  [PLABEL31]  18.43,25.27 0 bottom
PLABEL32  [PLABEL32]  18.55,18.77 0 bottom
PLABEL33  [PLABEL33]  18.68,32.21 0 bottom
PLABEL34  [PLABEL34]  16.9,9.69 0 bottom
PLABEL35  [PLABEL35]  26.5,2.02 0 bottom
Q1  10.41,9.14 270 top
Q3  22.86,30.48 0 top
Q4  32.26,30.35 0 top
Q6  34.92,7.11 270 top
R1  8.13,8.76 270 top
R2  18.67,30.35 270 top
R3  12.57,8.89 90 top
R4  17.02,30.35 270 top
R5  14.22,9.02 270 top
R6  20.32,30.35 270 top
R7  29.46,30.23 270 top
R8  22.1,10.67 90 top
R9  25.65,31.11 180 top
R10  25.65,29.59 0 top
R11  32.64,6.99 90 top
R12  37.21,6.99 270 top
R13  27.94,30.23 90 top
R14  10.03,19.3 180 top
R15  20.45,10.03 90 top
R16  30.99,6.48 270 top
R17  30.99,2.29 90 top
R18  14.48,2.16 270 top
R19  5.46,1.91 90 top
R20  5.46,5.46 270 top
R21  11.43,25.27 270 top
SJ1  5.84,23.11 90 bottom
SW1  26.54,4.06 0 top
U1  17.4,17.91 90 top
U2  4.06,29.59 90 top
U3  9.02,28.83 270 top
U4  9.91,3.56 270 top
U5  26.29,22.86 0 top
U6  26.54,18.61 0 top
U7  26.54,15.49 0 top
U$1  2.54,2.54 0 top
U$2  2.54,35.56 0 top
U$3  35.56,2.54 0 top
U$4  35.56,35.56 0 top
U$5  [ADAFRUIT_3.5MM]  24.51,24.89 0 top
U$6  [PCBFEAT-REV-040]  5.97,8.38 0 top
U$7  [ADAFRUIT_5MM]  36.07,19.43 0 bottom
Y1  9.91,21.21 180 top

### Tracks (layer width: path | path; a pad name or v marks a point on that pad's centre or on a via)
1.8V  (via drill 0.39)
  Top 0.178: U3.5 10.34,29.81 C5.1 FB2.1 15.11,29.81 | 15.11,29.81 FB3.1 15.28,29.81 17.4,27.69 18.54,27.69 19.05,27.18 | R1.2 8.13,8 9.27,9.14 Q1.2 Q1.5 11.98,9.14 R3.2 12.65,9.74 R5.2 14.48,7.91 C27.1 | U4.13 U4.14 13.76,6.44 C27.1 | 19.05,27.18 19.09,27.14 FB1.1 | Q3.2 22.86,29.08 22.35,28.57 | 19.05,27.18 20.07,28.19 21.97,28.19 22.35,28.57 | Q4.3 31.64,31.35 v30.48,32.51 | v15.18,31.05 15.18,29.87 15.11,29.81 | C27.1 14.52,6.48 v15.62,6.48 | v25.18,27.56 23.24,27.56 22.35,28.45 22.35,28.57
  Top 0.305: JP2.3 12.57,34.42 12.57,30.31 C5.1
  Bottom 0.178: v30.48,32.51 16.51,32.51 15.11,31.11 v15.18,31.05 | v15.62,6.48 15.95,6.15 18.99,6.15 25.19,12.35 25.19,27.39 25.02,27.56 v25.18,27.56
3.3V  (via drill 0.39)
  Top 0.178: Q6.5 Q6.2 33.9,6.99 32,6.99 31.75,6.74 31.75,6.68 30.99,5.91 R16.2 v30.99,4.32 R17.2 | J4.2 v18.55,3.82 v18.54,3.81 | R4.2 R2.2 | R2.2 R6.2 | R2.2 v18.67,28.35 | R10.2 25.23,28.32 v23.62,28.32 30.86,28.32 31.97,27.21 v31.97,19.73 | D2.A 8.36,24.22 v7.27,24.22
  Top 0.305: J1.22 7.2,24.3 v7.27,24.22 7.18,24.32 C2.1 7.72,26.32 U3.3 6.79,27.88 6.6,28.07 6.6,29.59 6.67,29.65 | 6.67,29.65 6.79,29.78 U3.1 8.06,29.78 9.53,31.24 9.53,34.92 JP2.2 | 6.67,29.65 5.78,30.54 U2.3 5.21,30.7 | C4.1 5.21,31.33 5.21,30.7 | U2.5 3.68,29.59 4.79,30.7 5.21,30.7
  Bottom 0.178: v18.54,3.81 22.48,3.81 23.11,3.17 26.54,3.17 | 26.54,3.17 29.59,3.17 30.73,4.32 v30.99,4.32 | v23.62,28.32 23.62,28.19 18.83,28.19 v18.67,28.35 15.02,28.35 10.89,24.22 v7.27,24.22 | 26.54,3.17 26.54,11.69 26.61,11.76 26.61,14.81 31.53,19.73 v31.97,19.73
5.0V  (via drill 0.39)
  Top 0.178: R12.2 36.41,5.33 v36.07,5.33 | v31.66,8.73 31.78,8.6 31.87,8.6 R11.2 | D1.A 24.89,13.22 27.45,13.22 v27.69,13.46
  Top 0.305: U2.1 5.36,28.04 v5.71,27.69 | C3.1 6.35,32.06 JP2.1
  Bottom 0.178: v36.07,5.33 34.92,5.33 33.91,4.32 33.4,4.32 31.66,6.06 v31.66,8.73 31.37,9.02 27.56,9.02 27.56,13.34 v27.69,13.46 27.69,15.38 31.37,19.06 32.25,19.06 33.5,20.31 33.5,33.43 32.89,34.04 32.89,36.45 32.13,37.21 8,37.21 JP2.1
  Bottom 0.305: v5.71,27.69 5.71,34.92 JP2.1
A_BCLK
  Top 0.178: U1.60 12.18,16.51 7.24,11.57 7.24,7.29 7.69,6.83 8.4,6.83 10.75,4.48 10.75,2.08 11.22,1.61 U4.8
A_DIN
  Top 0.178: U1.58 11.97,17.31 6.53,11.86 6.53,6.99 7.42,6.1 8.13,6.1 9.14,5.08 9.14,4.19 8.76,3.81 8.13,3.81 7.73,4.21 U4.3
A_LRCLK
  Top 0.178: U1.59 12.08,16.91 6.88,11.71 6.88,7.14 7.54,6.48 8.25,6.48 9.5,5.22 9.5,2.52 9.24,2.26 U4.6
AVDD  (via drill 0.39)
  Top 0.178: U1.5 16,12.82 15.4,12.22 15.4,11.63 15.14,11.38 v15.14,10.93 16.21,9.87 C15.1 C16.1 | U1.41 17.2,23.11 v17.33,23.24 17.33,24.22 C17.1 16.85,23.75 C14.1 16.09,23.88 15.33,24.64 13.48,24.64 13.34,24.79 | U1.26 23.4,18.51 C13.1 23.66,18.77 v23.27,18.77 | U1.50 12.32,20.51 | 12.32,20.51 12.32,19.81 12.45,19.68 13.46,19.68 U1.52 | 12.32,20.51 12,20.83 C12.1 12.83,21.69 12.83,24 13.34,24.51 13.34,24.79 | FB2.2 13.34,27.73 13.34,24.79
  Bottom 0.178: v15.14,10.93 15.66,10.41 19.56,10.41 21.84,12.7 21.84,17.65 22.92,18.73 | v23.27,18.77 22.96,18.77 22.92,18.73 | v17.33,23.24 18.8,23.24 22.92,19.11 22.92,18.73
BCLK  (via drill 0.39)
  Top 0.178: R18.2 13.53,2.26 U4.9 11.57,2.26 v11.56,2.27
  Bottom 0.178: JP2.11 31.75,34.54 33.02,33.27 33.02,21.72 26.26,14.95 26.26,11.91 19.43,5.08 13.34,5.08 11.56,3.3 v11.56,2.27
BIAS
  Top 0.178: U1.13 19.2,13.11 19.95,12.36 19.95,11.38 R15.2
DDC3_SCL
  Top 0.178: Q6.4 32.26,2.79 32.26,1.91 31.79,1.44 R17.1 30.82,1.26 29.08,1.26 | 29.08,1.26 SW1.S2 | J4.4 22.56,3.17 27.69,3.17 29.08,1.78 29.08,1.26
DDC3_SDA
  Top 0.178: 29.08,6.86 30.52,6.86 R16.1 30.99,9.4 32.64,9.4 34.02,8.01 Q6.1 | 29.08,6.86 SW1.S1 | J4.3 19.55,5.83 19.94,6.22 21.34,6.22 22.1,5.46 27.68,5.46 29.08,6.86
DDC_SCL  (via drill 0.39)
  Top 0.178: U7.1 U7.10 27.02,16.55 J2.15 30.19,16.55 30.23,16.51 31.84,16.51 v31.97,16.64 | Q6.3 32.88,6.36 32.66,6.13 R11.1 33.31,5.46 v33.78,5.46
  Bottom 0.178: v33.78,5.46 33.15,6.1 33.15,16 32.51,16.64 v31.97,16.64
DDC_SDA  (via drill 0.39)
  Top 0.178: U7.2 U7.9 27.02,16.05 J2.16 31.16,16.05 v31.37,15.84 | R12.1 35.85,7.83 Q6.6 35.81,7.87 v35.81,8.76
  Bottom 0.178: v31.37,15.84 31.11,16.1 31.11,16.76 31.66,17.3 32.73,17.3 33.53,16.51 33.53,9.4 34.16,8.76 v35.81,8.76
DIN  (via drill 0.39)
  Top 0.178: R20.2 5.71,4.86 U4.2 8.35,4.86 v8.38,4.83
  Bottom 0.178: JP2.9 27.94,34.29 30.86,34.29 32.18,32.97 32.18,21.89 25.55,15.25 25.55,12.2 19.14,5.79 11.51,5.79 10.54,4.82 10.54,4.83 v8.38,4.83
DSI0_N  (via drill 0.39)
  Top 0.178: U1.2 14.8,13.21 14.67,13.08 13.66,13.08 12.82,12.24 v12.82,11.91 | J1.2 4.65,14.3 v4.01,13.66
  Bottom 0.178: v12.82,11.91 12.82,12.16 12.64,12.34 5.19,12.34 4.01,13.53 v4.01,13.66
DSI0_P  (via drill 0.39)
  Top 0.178: v3.16,14.26 3.28,14.39 4.03,14.39 4.44,14.8 J1.3 | v11.84,11.68 11.84,11.89 13.41,13.46 14.22,13.46 14.4,13.64 U1.1
  Bottom 0.178: v3.16,14.26 3.16,13.57 4.74,11.99 11.53,11.99 v11.84,11.68
DSI1_N  (via drill 0.39)
  Top 0.178: J1.5 4.5,15.8 v4.06,15.37 | v14.73,11.91 14.73,12.06 15.6,12.93 U1.4
  Bottom 0.178: v4.06,15.37 6.35,13.08 14.32,13.08 14.73,12.67 v14.73,11.91
DSI1_P  (via drill 0.39)
  Top 0.178: J1.6 3.98,16.3 3.17,15.49 v2.92,15.49 | v13.8,12.28 14.12,12.6 14.75,12.6 15.2,13.04 U1.3
  Bottom 0.178: v2.92,15.49 2.99,15.49 3.79,14.7 4.23,14.7 6.23,12.7 13.38,12.7 v13.8,12.28
DSI2_N  (via drill 0.39)
  Top 0.178: U1.10 18,11.64 18.31,11.33 v18.31,11.18 | v3.8,18.61 4,18.8 J1.11
  Bottom 0.178: v18.31,11.18 18.31,11.43 18.05,11.68 18.05,12.6 16.13,14.53 7.43,14.53 4.71,17.25 4.71,17.7 4.11,18.29 3.8,18.29 v3.8,18.61
DSI2_P  (via drill 0.39)
  Top 0.178: J1.12 3.17,19.3 v2.67,18.8 | v17.2,11.12 17.2,11.25 17.6,11.64 U1.9
  Bottom 0.178: v2.67,18.8 3.52,17.94 3.96,17.94 4.35,17.55 4.35,17.11 7.29,14.17 15.98,14.17 17.68,12.47 17.68,11.73 17.2,11.25 v17.2,11.12
DSI3_N  (via drill 0.39)
  Top 0.178: U1.12 18.8,13.01 19.46,12.35 19.46,11.41 19.26,11.22 19.26,11.2 v19.28,11.18 | J1.14 4.14,20.3 v3.97,20.13
  Bottom 0.178: v19.28,11.18 19.28,11.24 19.46,11.41 19.46,12.35 16.57,15.24 7.73,15.24 5.42,17.55 5.42,17.99 4.82,18.58 4.82,19.28 v3.97,20.13
DSI3_P  (via drill 0.39)
  Top 0.178: U1.11 18.4,12.47 v18.79,12.07 | v3.05,20.7 3.15,20.8 J1.15
  Bottom 0.178: v18.79,12.07 18.79,12.37 16.27,14.88 7.58,14.88 5.06,17.4 5.06,17.84 4.47,18.44 4.47,18.88 4.08,19.27 3.74,19.27 3.05,19.96 v3.05,20.7
DSICK_N  (via drill 0.39)
  Top 0.178: J1.8 3.71,17.3 v3.68,17.27 | v16.89,12.06 16.83,12.13 17.2,12.5 U1.8
  Bottom 0.178: v16.89,12.06 16.89,12.7 15.77,13.82 7.14,13.82 v3.68,17.27
DSICK_P  (via drill 0.39)
  Top 0.178: U1.7 16.8,12.97 16.01,12.19 16.01,11.55 v16.14,11.43 | v2.67,17.4 2.7,17.36 3.28,17.94 3.96,17.94 4.1,17.8 J1.9
  Bottom 0.178: v16.14,11.43 16.14,12.57 15.24,13.46 6.99,13.46 3.85,16.61 3.14,16.61 2.7,17.05 2.7,17.43 v2.67,17.4
FLY_+
  Top 0.305: U2.6 1.17,28.64 C1.2
FLY_-
  Top 0.305: U2.4 1.37,30.54 C1.1
GND  (via drill 0.39)
  Top 0.178: U1.6 16.4,17.29 16.83,17.72 | 16.83,17.72 17.02,17.91 | 17.02,17.91 U1.EP 17.2,18.11 U1.56 | U1.17 20.75,14.91 20.74,14.92 19.62,14.92 17.02,17.53 | 17.02,17.53 16.83,17.72 | 17.53,17.53 19.84,17.53 20.03,17.34 21.27,17.34 U1.23 24.55,17.31 25.84,18.61 U6.3 | 17.53,17.53 17.02,17.53 | 19.2,19.2 19.71,19.71 U1.29 22.25,19.71 25.41,22.86 U5.3 | 19.2,19.2 17.53,17.53 | U1.32 21.27,20.87 20.29,20.87 19.98,20.57 19.68,20.57 17.65,18.54 | 17.65,18.54 17.02,17.91 | U1.36 19.2,19.2 | U1.42 16.8,18.8 | 16.8,18.8 16.8,17.75 16.83,17.72 | Y1.4 10.96,21.09 11.07,21.09 11.22,21.25 11.22,21.79 C12.2 | Y1.2 9.23,22.24 C24.2 | J2.17 27.02,15.55 U7.8 | U1.51 15.49,20.11 16.8,18.8 | U1.49 15.29,20.91 17.65,18.54 | R18.1 12.93,3.01 U4.10
  other vias: 13.59,22.61 7.37,22.86 7.37,18.29 7.49,16.89 9.14,16.13 1.65,24.26 1.02,22.1 0.76,19.56 0.76,17.27 0.76,14.99 0.89,10.03 3.56,10.16 5.59,10.16 12.57,26.92 12.57,24.89 9.02,28.83 6.86,30.61 4.06,27.94 1.4,31.75 4.45,33.4 8,33.53 10.67,30.73 22.1,30.48 31.24,23.11 26.92,20.95 16.26,26.92 20.45,27.43 30.61,30.35
  pour Top: 0,38.1 38.1,38.1 38.1,0 0,0
  pour Bottom: 0,38.1 38.1,38.1 38.1,0 0,0
HDMI_5V
  Top 0.178: J2.18 29.15,14.99 U7.7 U7.4 24.87,14.99 D1.C
HDMI_HPD
  Top 0.178: U7.5 U7.6 29.15,14.49 J2.19 31.7,14.55 32.64,15.49 32.64,27.56 32.26,27.94 32.26,30.1 31.28,31.08 R7.1 R13.2 26.54,31.08 R9.1
HOST_RST  (via drill 0.39)
  Top 0.178: JP2.7 22.11,35.04 Q3.6 20.5,31.38 R6.1 | J1.17 4.64,21.8 4.56,21.72 4.08,21.72 v3.82,21.47
  Bottom 0.178: v3.82,21.47 3.62,21.67 3.62,22.74 3.97,23.09 3.97,24.93 4.87,25.83 8.43,25.83 15.75,33.15 15.75,33.16 16.12,33.53 20.07,33.53 21.59,35.05 JP2.7
HPD_BASE
  Top 0.178: R7.2 31.29,29.38 Q4.1
HPD_HOST_B
  Top 0.178: Q3.5 22.86,30.99 23.11,30.73 24.38,30.73 24.77,31.11 R9.2
HPD_N  (via drill 0.39)
  Top 0.178: JP2.8 25.65,34.04 25.65,30.35 24.89,29.59 | Q3.3 24.88,29.58 24.89,29.59 | R10.1 24.89,29.59 | J1.18 4.37,22.3 v4.28,22.39
  Bottom 0.178: v4.28,22.39 4.57,22.68 4.57,25.02 5,25.45 8.55,25.45 16.12,33.02 21.59,33.02 JP2.8
LPF
  Top 0.178: U1.35 19.6,24.25 C26.1
LRCLK  (via drill 0.39)
  Top 0.178: R19.2 6.84,2.75 U4.5 8.62,2.91 v8.64,2.92
  Bottom 0.178: JP2.10 30.1,35.56 32.54,33.12 32.54,21.74 25.9,15.1 25.9,12.05 19.28,5.44 11.66,5.44 9.15,2.92 v8.64,2.92
LT_HPD
  Top 0.178: U1.14 19.6,13.21 20.98,11.84 21.78,11.84 R8.2 22.02,11.6 22.35,11.94 27.3,11.94 29.52,14.16 32.7,14.16 33.21,14.67 Q4.2
LT_RST  (via drill 0.39)
  Top 0.178: U1.64 11.18,12.6 11.18,11.4 11.57,11.01 13.08,11.01 R5.1 14.9,9.87 v15.49,9.27 | v21.46,28.86 22.11,29.51 Q3.1
  Bottom 0.178: v15.49,9.27 18.92,9.27 24.51,14.86 24.51,28.96 24.48,28.99 21.59,28.99 v21.46,28.86
LT_SCL  (via drill 0.39)
  Top 0.178: U1.62 12.38,15.71 9.53,12.85 9.53,11 v9.56,10.97 | R3.1 12.22,8.39 Q1.4 11.31,7.5 v11.3,7.49
  Bottom 0.178: v9.56,10.97 10.41,10.11 10.41,8.38 v11.3,7.49
LT_SDA
  Top 0.178: U1.61 12.28,16.11 8.89,12.71 8.89,10.52 Q1.1 9.23,9.61 R1.1
N$1  (via drill 0.39)
  Top 0.178: v10.29,26.16 10.33,26.12 R21.1
  Bottom 0.178: v10.29,26.16 9.22,25.09 6.81,25.09 5.84,24.13 SJ1.2
N$2
  Top 0.178: D2.C 10.06,24.42 R21.2
SCL  (via drill 0.39)
  Top 0.178: J1.20 4.25,23.3 3.65,22.7 2.71,22.7 v2.45,22.44 | Q1.3 9.53,8.38 v9.53,7.49 | SW1.P2 26.54,2.29 26.16,2.67 v20.07,2.67 | R4.1 16.51,31.71 JP2.5
  Bottom 0.178: JP2.5 16.51,34.92 8.13,26.54 4.45,26.54 2.58,24.68 2.58,22.57 v2.45,22.44 2.45,22 1.55,21.1 1.55,13.95 4.22,11.28 6.88,11.28 9.53,8.64 v9.53,7.49 9.02,7.49 6.99,5.46 6.99,2.67 8.64,1.02 13.34,1.02 14.99,2.67 v20.07,2.67
SDA  (via drill 0.39)
  Top 0.178: v10.7,10.81 11.31,10.2 Q1.6 | v3.3,23.37 3.73,23.8 J1.21 | SW1.P1 26.28,6.6 v25.27,6.6 | R2.1 18.67,35.18 JP2.6
  Bottom 0.178: JP2.6 19.05,34.92 18.16,34.04 16.12,34.04 8.28,26.19 4.72,26.19 3.3,24.77 v3.3,23.37 3.17,23.24 3.17,22.1 1.91,20.83 1.91,14.1 4.37,11.63 9.88,11.63 v10.7,10.81 10.79,10.81 12.06,9.54 12.06,6.99 11.68,6.6 8.63,6.6 7.37,5.34 7.37,2.79 8.78,1.37 13.19,1.37 16.29,4.48 19.33,4.48 21.46,6.6 v25.27,6.6
TMDS0_N
  Top 0.178: U1.24 24.31,17.71 25.71,19.11 U6.2 U6.9 27.42,19.11 27.87,19.55 J2.9
TMDS0_P
  Top 0.178: U1.25 24.21,18.11 25.71,19.61 U6.1 U6.10 26.96,19.98 27.56,20.57 28.19,20.57 28.26,20.51 29.17,20.51 J2.7
TMDS1_N
  Top 0.178: U1.27 22.46,18.91 25.42,21.86 U5.5 U5.6 27.09,21.86 27.9,21.05 J2.6
TMDS1_P
  Top 0.178: U1.28 22.36,19.31 25.41,22.36 U5.4 U5.7 27.21,22.36 27.48,22.1 29.16,22.1 J2.4
TMDS2_N
  Top 0.178: J2.3 27.9,22.55 27.09,23.36 U5.9 U5.2 25.4,23.36 22.15,20.11 U1.30
TMDS2_P
  Top 0.178: J2.1 27.91,23.55 27.6,23.86 U5.10 U5.1 25.4,23.86 22.05,20.51 U1.31
TMDSCK_N
  Top 0.178: U1.21 25.27,16.51 26.12,17.36 U6.5 U6.6 27.38,17.61 27.81,18.03 29.19,18.03 J2.12
TMDSCK_P
  Top 0.178: U1.22 24.65,16.91 25.85,18.11 U6.4 U6.7 27.31,18.11 27.56,18.35 27.56,18.73 27.88,19.05 J2.10
VDD  (via drill 0.39)
  Top 0.178: U1.18 22.5,15.31 C20.1 23.24,15.62 v23.37,15.75 | 20.97,22.71 21.38,23.11 C19.1 | 20.97,22.71 20.4,22.14 U1.33 | FB3.2 15.11,27.98 v15.11,26.92 15.11,26.25 C18.1 | U1.57 12.19,17.71 | 12.19,17.71 10.94,17.71 C21.1 | v21.59,21.97 20.97,22.59 20.97,22.71 | 12.19,17.71 v12.19,17.97
  Bottom 0.178: v23.37,15.75 24.13,16.51 24.13,21.08 23.24,21.97 v21.59,21.97 19.18,24.38 17.02,24.38 16.95,24.45 | 16.95,24.45 15.11,26.29 v15.11,26.92 | v12.19,17.97 12.19,19.68 16.95,24.45
VPLL
  Top 0.178: C26.2 20,23.98 U1.34 | C26.2 21.91,24.69 C7.1 C6.1 | FB1.2 C26.2
XI
  Top 0.178: C24.1 10.58,22.59 Y1.1 10.48,21.71 9.91,21.14 9.91,20.19 10.79,19.3 R14.1 U1.53
XO
  Top 0.178: U1.54 11.99,18.91 11.49,18.41 10.08,18.41 R14.2 9.18,19.49 | Y1.3 9.18,20.66 9.18,19.49 | 9.18,19.49 7.72,19.49 C25.1

### Text on the board
bPlace: LED
Pinguin_tBackup: 5V | 1V8 | SCL | RST | DIN | BCK | 3V3 | GND | SDA | HPD | LRC | DVI Output | 22 | 1 | LT8912B | Turn On / DCC<->I2C | DSI / to / DVI | DDC QT | Off | On
Pinguin_bBackup: 5V | 1V8 | SCL | RST | DIN | BCK | 3V3 | GND | SDA | HPD | LRC | 3.3V POWER / LOGIC | LT8912B | MIPI DSI to DVI / Converter with / optional I2S In | I2C Control/Config / I2C Addrs: 0x48,49,4A / HPD Active Low / FPC is 22pin RPi (max 4 lanes) | Switch connects / DDC I2C to FPC